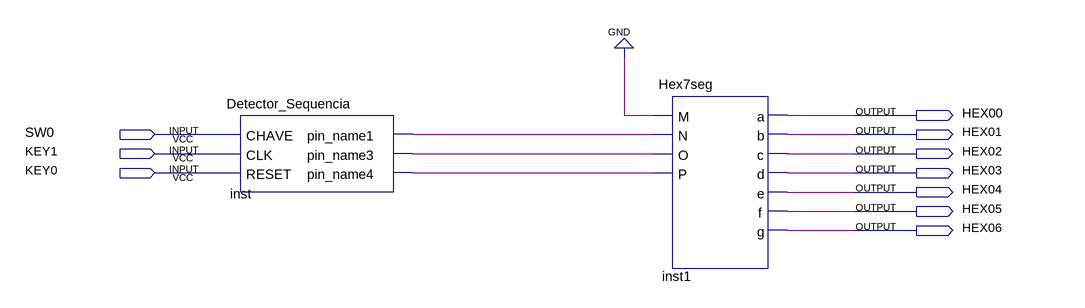
[diagram p0: schematic sheet]
// Quartus schematic Lab6.bdf as structural Verilog: 2 symbols, 10 pins
module Lab6 (
  input  SW0,
  input  KEY1,
  input  KEY0,
  output HEX00,
  output HEX01,
  output HEX02,
  output HEX03,
  output HEX04,
  output HEX05,
  output HEX06
);

  wire inst_pin_name1, inst_pin_name3, inst_pin_name4;

  Detector_Sequencia inst (
    .CHAVE(SW0), .CLK(KEY1), .RESET(KEY0), .pin_name1(inst_pin_name1), .pin_name3(inst_pin_name3),
    .pin_name4(inst_pin_name4));
  Hex7seg inst1 (
    .M(1'b0), .N(inst_pin_name1), .O(inst_pin_name3), .P(inst_pin_name4), .a(HEX00), .b(HEX01), .c(HEX02),
    .d(HEX03), .e(HEX04), .f(HEX05), .g(HEX06));
endmodule
